# Altium schematic sheet Peripherals.SchDoc
size A3; SheetNumber: 5; SheetTotal: 7
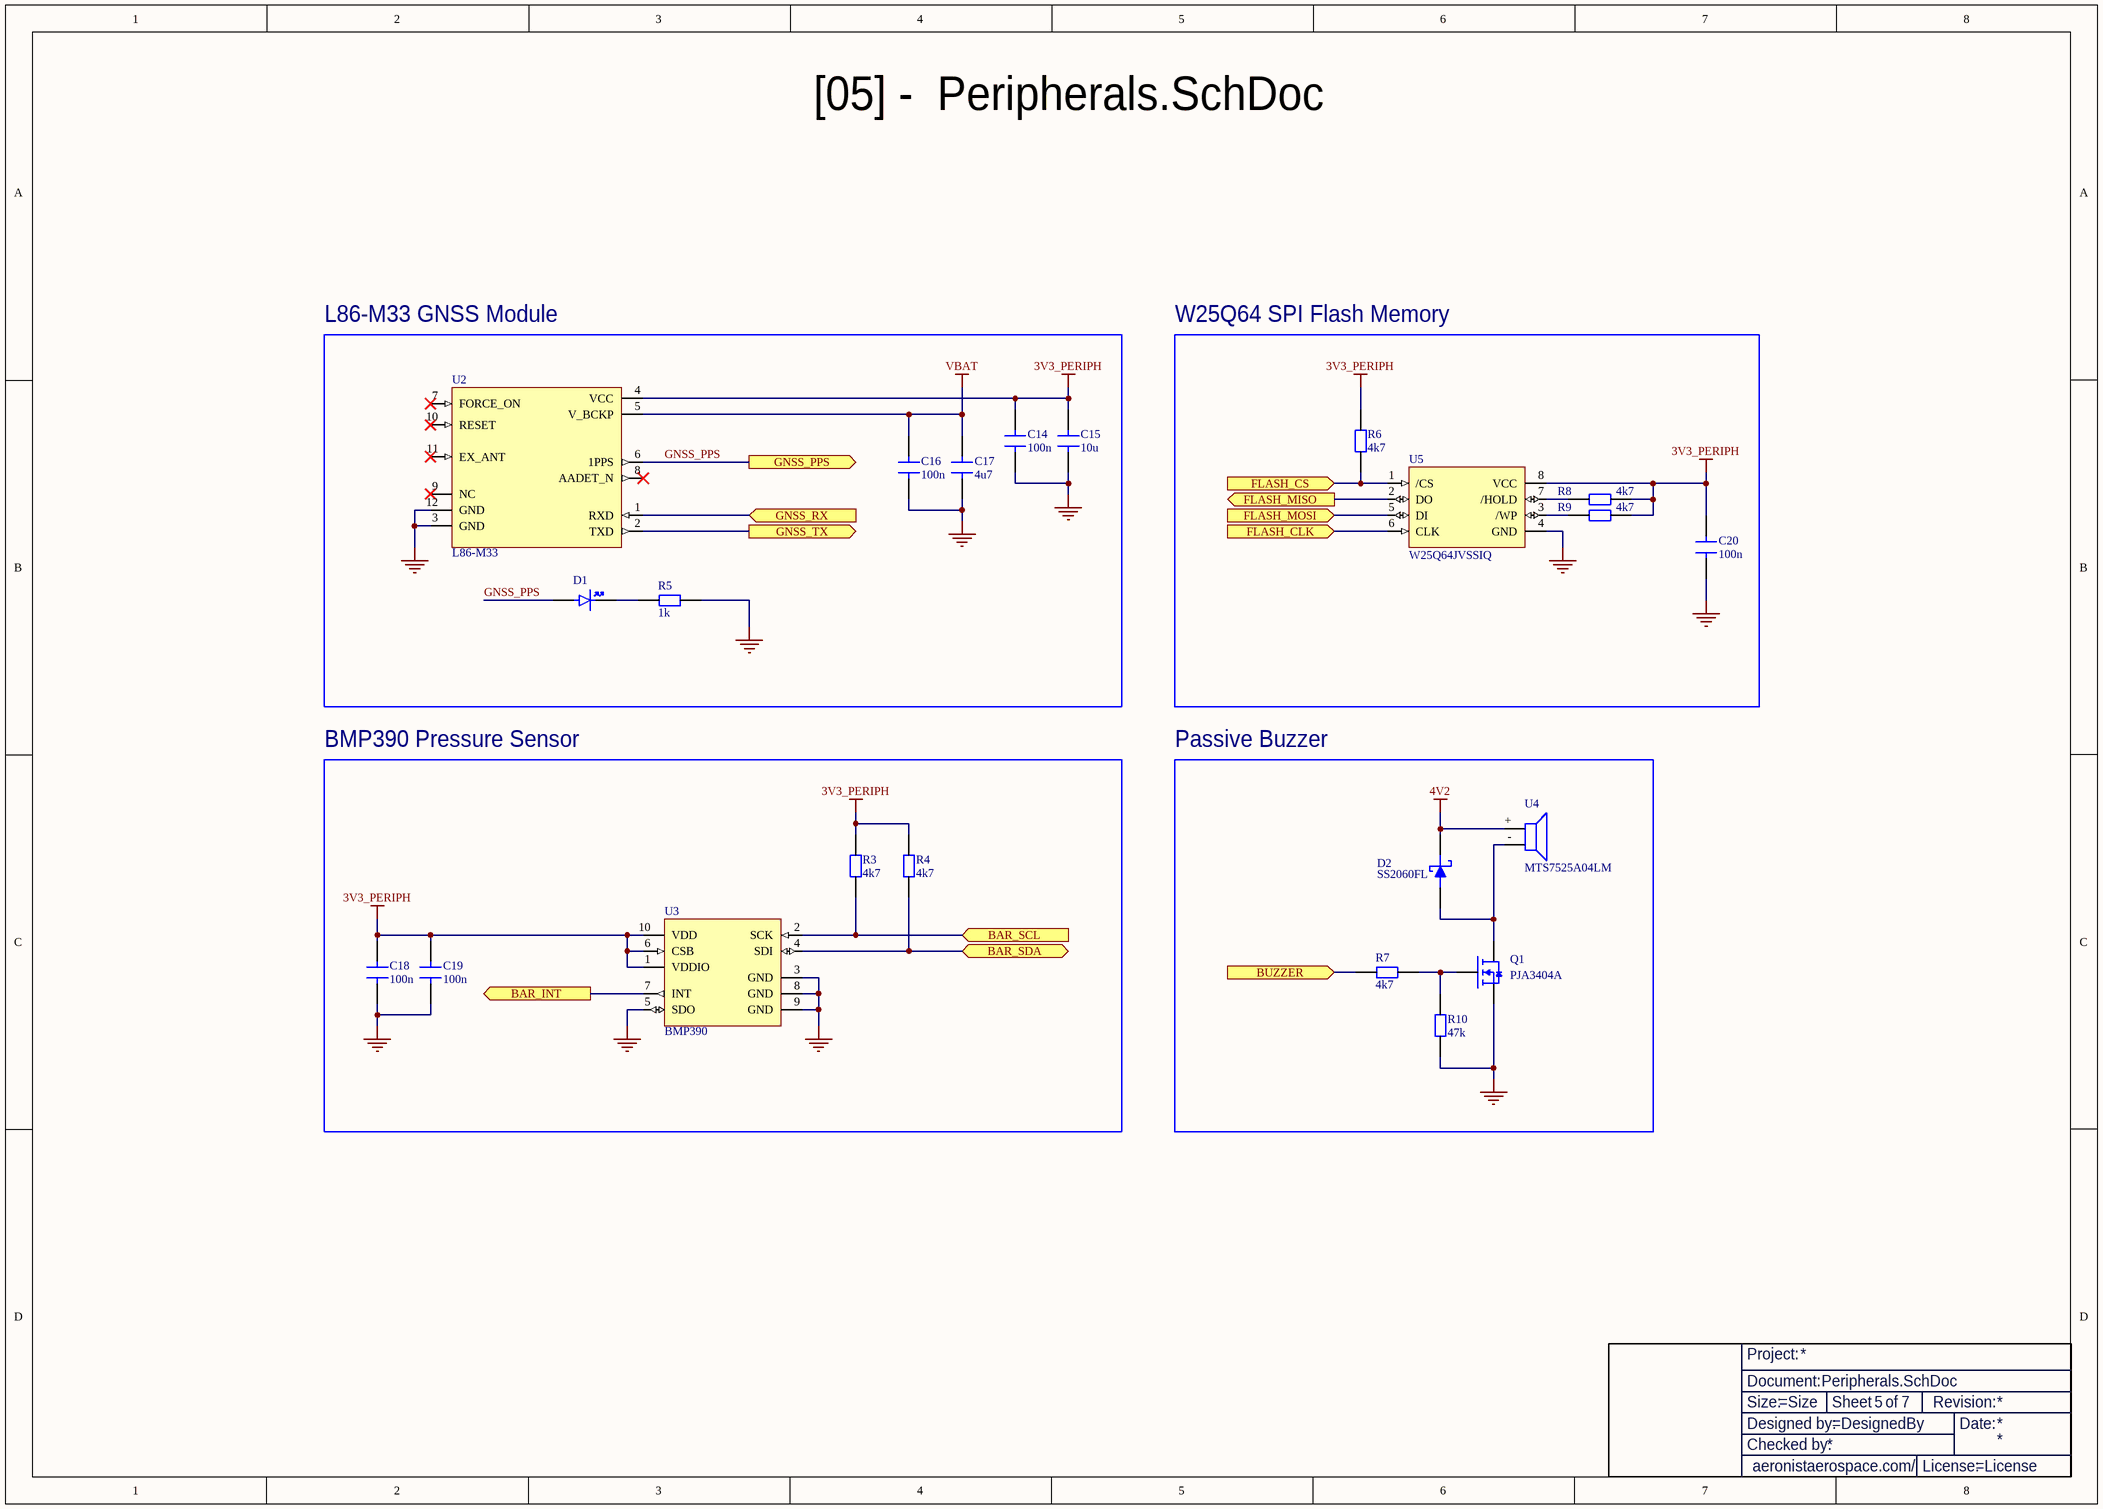
[diagram p0: Peripherals.SchDoc]

## Parts
?  Title Block  (value not drawn)  (graphical)
C14  100n  [CAP 0402]
C15  10u  [CAP 0603]
C16  100n  [CAP 0402]
C17  4u7  [CAP 0603]
C18  100n  [CAP 0402]
C19  100n  [CAP 0402]
C20  100n  [CAP 0402]
D1  LED 0805  [LED 0805]  (value not drawn)
D2  SS2060FL  [SOD-123FL]
Q1  PJA3404A  [SOT23-3]
R3  4k7  [RES 0402]
R4  4k7  [RES 0402]
R5  1k  [RES 0402]
R6  4k7  [RES 0402]
R7  4k7  [RES 0402]
R8  4k7  [RES 0402]
R9  4k7  [RES 0402]
R10  47k  [RES 0402]
U2  L86-M33  [L86-M33]
U3  BMP390  [BMP390]
U4  MTS7525A04LM  [MTS7525A04LM]
U5  W25Q64JVSSIQ  [SOP-8]

## Blocks framed on the sheet
L86-M33 GNSS Module: C14-C17 D1 R5 U2
W25Q64 SPI Flash Memory: C20 R6 R8 R9 U5
BMP390 Pressure Sensor: C18 C19 R3 R4 U3
Passive Buzzer: D2 Q1 R7 R10 U4

## Ports
BAR_INT (out, see MCU[6C]), BAR_SCL (in, see MCU[4C]), BAR_SDA (bidir, see MCU[4C]), BUZZER (in, see MCU[6C]), FLASH_CLK (in, see MCU[6C]), FLASH_CS (in, see MCU[6C]), FLASH_MISO (out, see MCU[6B]), FLASH_MOSI (in, see MCU[6B]), GNSS_PPS (out, see MCU[4C]), GNSS_RX (in, see MCU[4C]), GNSS_TX (out, see MCU[4C])

## Nets
3V3_PERIPH: C14.2 C15.2 C18.2 C19.2 C20.2 R3.2 R4.2 R6.1 R8.2 R9.2 U2.4(VCC) U3.1(VDDIO) U3.6(CSB) U3.10(VDD) U5.8(VCC)
4V2: D2.2 U4.+
GND: C14.1 C15.1 C16.1 C17.1 C18.1 C19.1 C20.1 Q1.2(S) R5.2 R10.1 U2.3(GND) U2.12(GND) U3.3(GND) U3.5(SDO) U3.8(GND) U3.9(GND) U5.4(GND)
VBAT: C16.2 C17.2 U2.5(V_BCKP)
BAR_INT: U3.7(INT) ; port BAR_INT
BAR_SCL: R3.1 U3.2(SCK) ; port BAR_SCL
BAR_SDA: R4.1 U3.4(SDI) ; port BAR_SDA
BUZZER: R7.2 ; port BUZZER
FLASH_CLK: U5.6(CLK) ; port FLASH_CLK
FLASH_CS: R6.2 U5.1(/CS) ; port FLASH_CS
FLASH_MISO: U5.2(DO) ; port FLASH_MISO
FLASH_MOSI: U5.5(DI) ; port FLASH_MOSI
GNSS_PPS: D1.A U2.6(1PPS) ; port GNSS_PPS
GNSS_RX: U2.1(RXD) ; port GNSS_RX
GNSS_TX: U2.2(TXD) ; port GNSS_TX
NetD1_K: D1.K R5.1
NetD2_1: D2.1 Q1.3(D) U4.-
NetQ1_1: Q1.1(G) R7.1 R10.2
NetR8_1: R8.1 U5.7(/HOLD)
NetR9_1: R9.1 U5.3(/WP)

Not connected (* = marked no-connect by the designer): U2 7(FORCE_ON)* 8(AADET_N)* 9(NC)* 10(RESET)* 11(EX_ANT)*

## Notes on the sheet
- [05] -  Peripherals.SchDoc
- (in symbol Title Block) Project:; Document:; Size:; Sheet; of; Revision:; Designed by:; Date:; Checked by:; aeronistaerospace.com/; License:

## Library data of the parts
C14 C16 C18-C20 = CAP 0402: Capacitor SMD 0402
C15 C17 = CAP 0603: Capacitor SMD 0603
D1 = LED 0805: LED 0805 SMD
D2 = SS2060FL: Rectifier Diode, Schottky, 1 Phase, 1 Element, 2A, 60V V(RRM), Silicon; Manufacturer: Panjit; Manufacturer Part Number: SS2060FL_R1_00001; Element Configuration: Single; Forward Voltage: 700mV; Max Forward Surge Current (Ifsm): 50A; Number of Elements: 1; Peak Reverse Current: 40µA; Supplier: Mouser; Supplier Part Number: 241-SS2060FLR100001; RoHS: Compliant; Category: Rectifier Diodes; Stock: 5102; Pricing: 1=0,36, 10=0,232, 50=0,232, 100=0,161, 1000=0,107, 10000=0,067 (USD); Lifecycle Status: Production; Max Operating Temperature: 150°C; Max Output current: 2A; Max Repetitive Reverse Voltage (Vrrm): 60V; Min Operating Temperature: -50°C; Mounting Technology: Surface Mount; Pins: 2; Number of Terminals: 2; Peak Non-Repetitive Surge Current: 50A; Radiation Hardening: No; REACH SVHC: No; Reverse Standoff Voltage: 60V; ComponentLink1URL: https://datasheet.octopart.com:443/SS2060FL_R1_00001-Panjit-datasheet-151294498.pdf?src-supplier=IHS; ComponentLink1Description: https://datasheet.octopart.com:443/SS2060FL_R1_00001-Panjit-datasheet-151294498.pdf?src-supplier=IHS; ComponentLink2URL: https://datasheet.octopart.com:443/SS2060FL_R1_00001-Panjit-datasheet-180983485.pdf?src-supplier=IHS; ComponentLink2Description: https://datasheet.octopart.com:443/SS2060FL_R1_00001-Panjit-datasheet-180983485.pdf?src-supplier=IHS
Q1 = MOSFET N-CH: SOT-23-3 package, N-Channel MOSFET
R3-R10 = RES 0402: Resistor SMD 0402
U2 = L86-M33: GNSS Module, Galileo, GLONASS, GPS, QZSS, 1.57542GHz, 1.60171GHz, -167 dBm, 35 s, 3V to 4.3V; Manufacturer: Quectel; Number of Circuits: 1; Operating Supply Voltage: 3.3V; Supplier: Mouser; Supplier Part Number: 277-L86-M33; Manufacturer Part Number: L86-M33; RoHS: Compliant; Category: RF Transceiver Modules and Modems; Stock: 1427; Pricing: 1=12,82, 10=11,15, 50=10,56, 100=9,77, 1000=8,75, 10000=8,75 (USD); Height - Seated (Max): 7.15mm; Length: 18.4mm; Max Operating Temperature: 85°C; Min Operating Temperature: -40°C; Number of Terminals: 12; REACH SVHC: Yes; Width: 18.4mm; ComponentLink1URL: https://datasheet.octopart.com:443/L86-M33-Quectel-datasheet-181153375.pdf?src-supplier=IHS; ComponentLink1Description: https://datasheet.octopart.com:443/L86-M33-Quectel-datasheet-181153375.pdf?src-supplier=IHS; ComponentLink2URL: https://datasheet.octopart.com:443/L86-M33-Quectel-datasheet-163887215.pdf?src-supplier=SOS+electronic; ComponentLink2Description: https://datasheet.octopart.com:443/L86-M33-Quectel-datasheet-163887215.pdf?src-supplier=SOS+electronic; ComponentLink3URL: https://datasheet.octopart.com/L86-M33-Quectel-datasheet-77840748.pdf; ComponentLink3Description: https://datasheet.octopart.com/L86-M33-Quectel-datasheet-77840748.pdf
U3 = BMP390: Pressure sensor, 300-1250hPa, 2.0*2.0*0.75mm, I2C/SPI; Manufacturer: Bosch Sensortec; Supplier: Future Electronics; Supplier Part Number: 3151950; Manufacturer Part Number: BMP390; RoHS: Compliant; Category: Pressure Sensors; Stock: 106; Pricing: 1=3,29, 20=3,01, 150=2,83, 1000=2,65, 5000=2,5 (USD); ComponentLink1URL: https://datasheet.octopart.com:443/BMP390-Bosch-Sensortec-datasheet-164327956.pdf?src-supplier=Future+Electronics; ComponentLink1Description: https://datasheet.octopart.com:443/BMP390-Bosch-Sensortec-datasheet-164327956.pdf?src-supplier=Future+Electronics
U4 = MTS7525A04LM: 7.5 x 7.5 mm magnetic passive buzzer, SMT, 3.6 V (2.5–4.5 V), 2.7 kHz, 85 dB.
U5 = W25Q64JVSSIQ: NOR Flash Serial (SPI, Dual SPI, Quad SPI) 3V/3.3V 64M-bit 8M x 8 6ns 8-Pin SOIC T/R/Tray/Tube; Manufacturer: Winbond; Address Bus Width: 24b; Density: 512Mb; Frequency: 133MHz; Max Supply Current: 18mA; Max Supply Voltage: 3.6V; Memory Size: 8MB; Min Supply Voltage: 2.7V; Number of Circuits: 1; Operating Supply Voltage: 3V; Page Size: 256B; Supplier: Arrow Electronics; Supplier Part Number: W25Q64JVSSIQ; Manufacturer Part Number: W25Q64JVSSIQ; RoHS: Compliant; Category: Flash; Stock: 305; Pricing: 90=0,8058, 180=0,804, 270=0,785 (USD); Access Time: 6ns; Ambient Temperature Range High: 85°C; Case/Package: SOIC; China RoHS: Compliant; Height: 2.16mm; Height - Seated (Max): 2.16mm; Interface: Serial; Length: 5.23mm; Lifecycle Status: Production; Clock Frequency: 133MHz; Max Operating Temperature: 85°C; Memory Format: FLASH; Min Operating Temperature: -40°C; Mounting Technology: Surface Mount; Pins: 8; Number of Terminals: 8; REACH SVHC: Yes; Schedule B: 8542320070, 8542320070|8542320070, 8542320070|8542320070|8542320070, 8542320070|8542320070|8542320070|8542320070; Terminal Pitch: 1.27mm; Width: 5.23mm; ComponentLink1URL: https://datasheet.octopart.com:443/W25Q64JVSSIQ-Winbond-datasheet-179437472.pdf?src-supplier=IHS; ComponentLink1Description: https://datasheet.octopart.com:443/W25Q64JVSSIQ-Winbond-datasheet-179437472.pdf?src-supplier=IHS; ComponentLink2URL: https://datasheet.octopart.com:443/W25Q64JVSSIQ-Winbond-datasheet-138898694.pdf?src-supplier=ODG+(Origin+Data+Global); ComponentLink2Description: https://datasheet.octopart.com:443/W25Q64JVSSIQ-Winbond-datasheet-138898694.pdf?src-supplier=ODG+(Origin+Data+Global); ComponentLink3URL: https://sigma.octopart.com:443/138898685/technical_drawing/Winbond-W25Q64JVSSIQ.pdf?src-supplier=Upverter; ComponentLink3Description: https://sigma.octopart.com:443/138898685/technical_drawing/Winbond-W25Q64JVSSIQ.pdf?src-supplier=Upverter